# Altium schematic sheet AUDIO.SchDoc: AUDIO
size A4; Author: Silvio Navaretti; CompanyName: Arduino srl; DocumentNumber: ABX00063; Revision: V1.4; SheetNumber: 7; SheetTotal: 8; RevAuthor: Silvio Navaretti
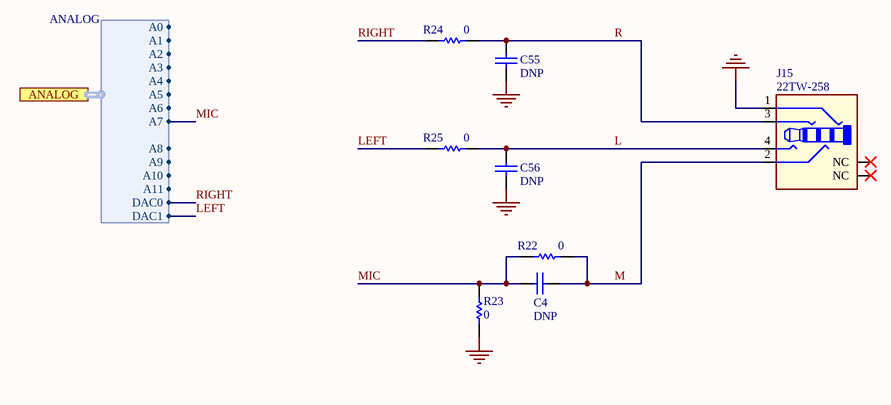
[diagram p0: AUDIO.SchDoc]

## Parts
C4  DNP CAP 0402  [CAP-0402]  (value not drawn)
C55  DNP CAP 0402  [CAP-0402]  (value not drawn)
C56  DNP CAP 0402  [CAP-0402]  (value not drawn)
J15  22TW-258  [22TW-258-Footprint-1]
R22  value 0  [RES-0402]  (hidden comment: CRCW04020000Z0EDC)
R23  value 0  [RES-0402]  (hidden comment: CRCW04020000Z0EDC)
R24  value 0  [RES-0402]  (hidden comment: CRCW04020000Z0EDC)
R25  value 0  [RES-0402]  (hidden comment: CRCW04020000Z0EDC)

## Ports
ANALOG (harness ANALOG)

## Harnesses
ANALOG: A0, A1, A2, A3, A7, A6, A5, A4, A8, A9, A10, A11, DAC0, DAC1

## Nets
GND: C55.1 C56.1 J15.1 R23.1
L: C56.2 J15.4 R25.2
LEFT: R25.1 ; port ANALOG.DAC1
M: C4.1 J15.2 R22.2
MIC: C4.2 R22.1 R23.2 ; port ANALOG.A7
R: C55.2 J15.3 R24.2
RIGHT: R24.1 ; port ANALOG.DAC0

Not connected (* = marked no-connect by the designer): J15 NC1(NC)* NC2(NC)*

## Notes on the sheet
- Title:
- ID:
- Date:
- Time:
- Version:
- Sheet
- of
- RevAuthor:
- Reference Designs ARE PROVIDED "AS IS" AND "WITH ALL FAULTS. Arduino SA DISCLAIMS ALL OTHER WARRANTIES, EXPRESS OR IMPLIED, REGARDING PRODUCTS, INCLUDING BUT NOT LIMITED TO, ANY IMPLIED WARRANTIES OF MERCHANTABILITY OR FITNESS FOR A PARTICULAR PURPOSE.
  Arduino SA may make changes to specifications and product descriptions at any time, without notice. The Customer must not rely on the absence or characteristics of any features or instructions marked "reserved" or "undefined". Arduino SA reserves these for future definition and shall have no responsibility whatsoever for conflicts or incompatibilities arising from future changes to them. The product information on the Web Site or Materials is subject to change without notice.
  Do not finalize a design with this info. ARDUINO and other Arduino brands and logos and Trademarks of Arduino SA. All Arduino SA Trademarks cannot be used without owner's formal permission.
- File:
- Author:

## Library data of the parts
C4 C55 C56 = C0095-A.6: Code Arduino: C0095; Part Number: DNP; Case Code (Imperial): 0402; Technology: Ceramic
J15 = J0273-A.8: Conn Jack 4 POLES 3.5mm SMD; Manufacturer: 4UCONN; Code Arduino: J0273; Part Number: 22TW-258
R22-R25 = R0000-A.23: RES CHIP 0402 0R 1/16W; Manufacturer: Vishay; Power: 62.5mW; Tolerance: 0%; Code Arduino: 0039; Temperature coefficient: 0ppm; Part Number: CRCW04020000Z0EDC; Case Code (Imperial): 0402; Technology: Thick film